# Altium schematic sheet CC1101-Sheet.SchDoc
size A4; SheetNumber: 3; SheetTotal: 3
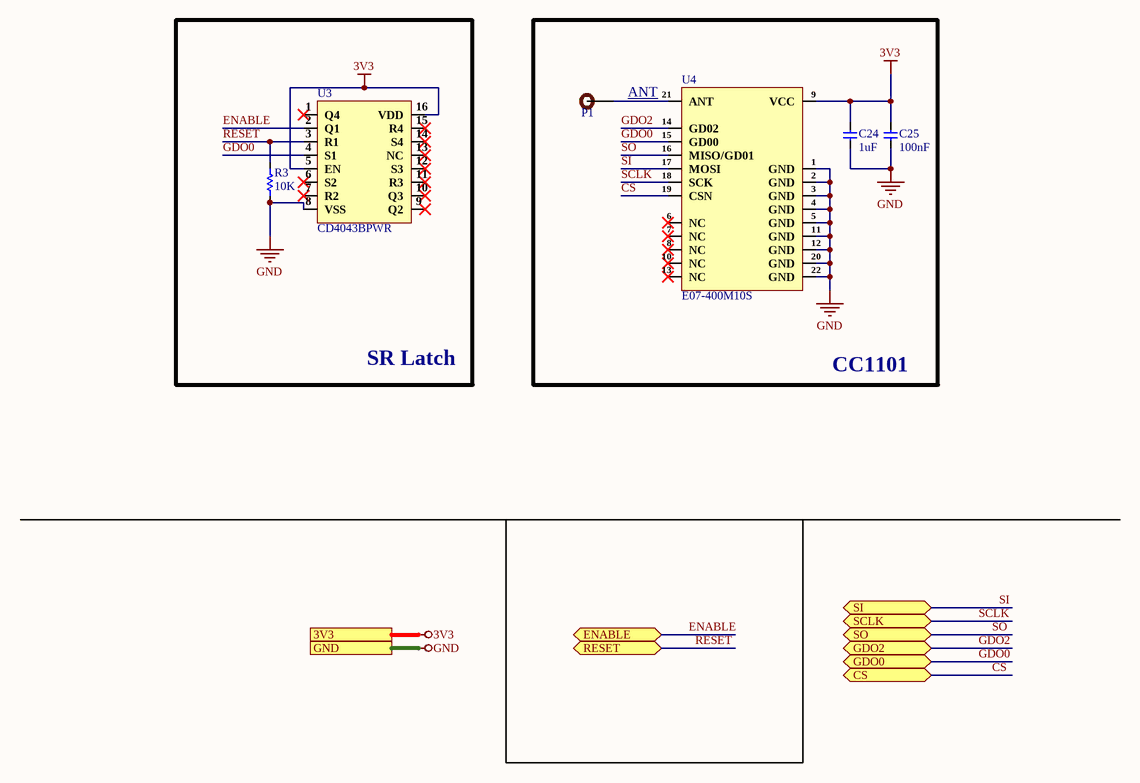
[diagram p0: CC1101-Sheet.SchDoc]

## Parts
C24  1uF  [Cap-0201]
C25  100nF  [Cap-0201]
P1  TEST POINT  [Test-point]  (value not drawn)
R3  10K  [Res-0201]
U3  CD4043BPWR  [TSSOP_16]
U4  E07-400M10S  [E07-400M10S]

## Blocks framed on the sheet
SR Latch: R3 U3
CC1101: C24 C25 P1 U4

## Ports
3V3 (see Top-Sheet[2C], Controller-Sheet[1D]), CS (bidir, see Top-Sheet[2B], Controller-Sheet[3D]), ENABLE (bidir, see Top-Sheet[2B], Controller-Sheet[2D]), GDO0 (bidir, see Top-Sheet[2B], Controller-Sheet[3D]), GDO2 (bidir, see Top-Sheet[2B], Controller-Sheet[3D]), GND (see Top-Sheet[2C], Controller-Sheet[1D]), RESET (bidir, see Top-Sheet[2B], Controller-Sheet[2D]), SCLK (bidir, see Top-Sheet[2B], Controller-Sheet[3D]), SI (bidir, see Top-Sheet[2B], Controller-Sheet[3D]), SO (bidir, see Top-Sheet[2B], Controller-Sheet[3D])

## Nets
3V3: C24.2 C25.2 U3.5(EN) U3.16(VDD) U4.9(VCC) ; port 3V3
GND: C24.1 C25.1 R3.1 U3.8(VSS) U4.1(GND) U4.2(GND) U4.3(GND) U4.4(GND) U4.5(GND) U4.11(GND) U4.12(GND) U4.20(GND) U4.22(GND) ; port GND
CS: U4.19(CSN) ; port CS
ENABLE: U3.2(Q1) ; port ENABLE
GDO0: U3.4(S1) U4.15(GD00) ; port GDO0
GDO2: U4.14(GD02) ; port GDO2
RESET: R3.2 U3.3(R1) ; port RESET
SCLK: U4.18(SCK) ; port SCLK
SI: U4.17(MOSI) ; port SI
SO: U4.16(MISO/GD01) ; port SO
NetP1_1: P1.1 U4.21(ANT)

Not connected (* = marked no-connect by the designer): U3 1(Q4)* 6(S2)* 7(R2)* 9(Q2)* 10(Q3)* 11(R3)* 12(S3)* 13(NC)* 14(S4)* 15(R4)*; U4 6(NC)* 7(NC)* 8(NC)* 10(NC)* 13(NC)*

## Notes on the sheet
- ANT <Add 10pF cap here>
- File:
- Title:
- Date:
- Page
- Num:
- Total:
- Drawn By: Huzaifa Ali

## Library data of the parts
C24 = CC0201KRX5R5BB105: CAP CER 1UF 6.3V X5R 0201; Manufacturer: Yageo; Tolerance: 10%; Item Type: Capacitor; Supplier 1: Arrow Electronics; Manufacturer Part Number: CC0201KRX5R5BB105; RoHS: Yes; Category: Ceramic Capacitors; Stock 1: 600000; Pricing 1: 15000=0.00740 (USD); Mount: Surface Mount; Case/Package: 0201; Case Code (Imperial): 0201; Case Code (Metric): 0603; Min Operating Temperature: -55°C; Max Operating Temperature: 85°C; Packaging: Cut Tape; Capacitance: 1uF; Voltage Rating: 6.3V; RoHS Compliant: Yes; ComponentLink1URL: http://www.yageo.com/documents/recent/UPY-GPHC_X5R_4V-to-50V_25.pdf?src-supplier=Digi-Key; ComponentLink1Description: http://www.yageo.com/documents/recent/UPY-GPHC_X5R_4V-to-50V_25.pdf?src-supplier=Digi-Key; ComponentLink2URL: https://www.yageo.com/upload/media/product/productsearch/datasheet/mlcc/UPY-GPHC_X5R_4V-to-50V_26.pdf?src-supplier=Digi-Key; ComponentLink2Description: https://www.yageo.com/upload/media/product/productsearch/datasheet/mlcc/UPY-GPHC_X5R_4V-to-50V_26.pdf?src-supplier=Digi-Key; Supplier Part Number 1: CC0201KRX5R5BB105; LCSC Part Number: C541330
C25 = CC0201KRX5R5BB104: CAP CER 0.1UF 6.3V X5R 0201; Manufacturer: Yageo; Tolerance: 10%; Supplier 1: Avnet; Manufacturer Part Number: CC0201KRX5R5BB104; RoHS: Yes; Category: Ceramic Capacitors; Stock 1: 1290000; Pricing 1: 15000=0.00238 (USD); Mount: Surface Mount; Case/Package: 0201; Number of Pins: 2; Case Code (Imperial): 0201; Case Code (Metric): 0603; Min Operating Temperature: -55°C; Max Operating Temperature: 85°C; Capacitance: 100nF; Dielectric: X5R; Voltage Rating: 6.3V; Packaging: Tape and Reel; Package Quantity: 1; Voltage Rating (DC): 6.3V; Termination: SMD/SMT; Resistor Type: Ceramic; Series: CC; Length: 0.6mm; Width: 0.012inch; Height: 0.3mm; Thickness: 0.013inch; Depth: 0.3mm; Reach SVHC Compliant: Yes; Lead Free: Lead Free; Halogen Free: Halogen Free; RoHS Compliant: Yes; ComponentLink1URL: https://datasheet.ciiva.com/7656/1525783-7656597.pdf?src-supplier=Element14; ComponentLink1Description: https://datasheet.ciiva.com/7656/1525783-7656597.pdf?src-supplier=Element14; ComponentLink2URL: https://datasheet.ciiva.com/28450/1359354-28450200.pdf?src-supplier=Element14; ComponentLink2Description: https://datasheet.ciiva.com/28450/1359354-28450200.pdf?src-supplier=Element14; ComponentLink3URL: https://datasheet.ciiva.com/176/mlccorderingcode-176766.pdf?src-supplier=Digi-Key; ComponentLink3Description: https://datasheet.ciiva.com/176/mlccorderingcode-176766.pdf?src-supplier=Digi-Key; ComponentLink4URL: https://datasheet.ciiva.com/176/mlccorderingcode-176765.pdf?src-supplier=Digi-Key; ComponentLink4Description: https://datasheet.ciiva.com/176/mlccorderingcode-176765.pdf?src-supplier=Digi-Key; ComponentLink5URL: https://datasheet.ciiva.com/176/mlccorderingcode-176767.pdf?src-supplier=Digi-Key; ComponentLink5Description: https://datasheet.ciiva.com/176/mlccorderingcode-176767.pdf?src-supplier=Digi-Key; Supplier Part Number 1: CC0201KRX5R5BB104
P1 = TEST POINT: Test Point ON; Item Type: TEST POINT
R3 = RC0201JR-0710KL: RES SMD 10K OHM 5% 1/20W 0201; Manufacturer: Yageo; Voltage Rating (DC): 25V; Power Rating: 50mW; Resistance: 10kR; Temperature Coefficient: 200ppm/°C; Case Code (Imperial): 0201; Case Code (Metric): 0603; Case/Package: 0201; Category: Chip SMD Resistors; Contact Plating: Tin,Matte; Depth: 0.3mm; Lead Free: Lead Free; Length: 0.6mm; Manufacturer Part Number: RC0201JR-0710KL; Max Operating Temperature: 125°C; Military Standard: Not; Min Operating Temperature: -55°C; Packaging: Tape and Reel; Radiation Hardening: No; REACH SVHC: Unknown; Resistor Type: Thick Film; Termination: SMD/SMT; Tolerance: 5%; Voltage Rating: 25V; ComponentLink1Description: New link; ComponentLink1URL: *; Supplier 1: Digi-Key; RoHS: Yes; Stock 1: 1488597; Pricing 1: 1=0.10000, 10=0.02600, 100=0.01050, 1000=0.00472, 2500=0.00410, 5000=0.00338 (USD); ComponentLink2URL: https://datasheet.ciiva.com/8891/pyu-rc0201-51-rohs-l-8-8891388.pdf?src-supplier=Avnet; ComponentLink2Description: https://datasheet.ciiva.com/8891/pyu-rc0201-51-rohs-l-8-8891388.pdf?src-supplier=Avnet; ComponentLink3URL: https://datasheet.ciiva.com/7672/1563626-7672253.pdf?src-supplier=Element14; ComponentLink3Description: https://datasheet.ciiva.com/7672/1563626-7672253.pdf?src-supplier=Element14; ComponentLink4URL: https://datasheet.ciiva.com/28405/pyu-rc0201-51-rohs-l-8-28405613.pdf?src-supplier=Avnet+Europe; ComponentLink4Description: https://datasheet.ciiva.com/28405/pyu-rc0201-51-rohs-l-8-28405613.pdf?src-supplier=Avnet+Europe; ComponentLink5URL: https://datasheet.ciiva.com/7672/1563626-7672254.pdf?src-supplier=Element14; ComponentLink5Description: https://datasheet.ciiva.com/7672/1563626-7672254.pdf?src-supplier=Element14; ComponentLink6URL: https://datasheet.ciiva.com/7660/1421516-7660810.pdf?src-supplier=Element14; ComponentLink6Description: https://datasheet.ciiva.com/7660/1421516-7660810.pdf?src-supplier=Element14; ComponentLink7URL: https://datasheet.ciiva.com/16856/pyu-rc0201-51-rohs-l-8-16856011.pdf?src-supplier=Avnet+Europe; ComponentLink7Description: https://datasheet.ciiva.com/16856/pyu-rc0201-51-rohs-l-8-16856011.pdf?src-supplier=Avnet+Europe; ComponentLink8URL: https://datasheet.ciiva.com/46391/1421516-46391291.pdf?src-supplier=Element14; ComponentLink8Description: https://datasheet.ciiva.com/46391/1421516-46391291.pdf?src-supplier=Element14; Supplier Part Number 1: 311-10KNCT-ND; LCSC Part Number: C138117
U3 = CD4043BPWR: 16-Bit Transparent D-Type Latch With 3-State Outputs 48-TVSOP -40 to 125; Manufacturer: Texas Instruments; Manufacturer Part Number: SN74LVC16373ADGVR; Item Type: IC; Supplier: Digi-Key; Supplier Part Number: 296-13242-1-ND; RoHS: Yes; Category: Latches and Flip Flops; Stock: 4536; Pricing: 1=1.51, 10=1.353, 25=1.284, 100=1.0546, 250=0.98588, 500=0.87122, 1000=0.68781 (USD); ComponentLink1URL: https://datasheet.ciiva.com/14288/sn74lvc16373a-14288272.pdf?src-supplier=Avnet; ComponentLink1Description: https://datasheet.ciiva.com/14288/sn74lvc16373a-14288272.pdf?src-supplier=Avnet; ComponentLink2URL: https://datasheet.ciiva.com/22746/1840227-22746081.pdf?src-supplier=Element14; ComponentLink2Description: https://datasheet.ciiva.com/22746/1840227-22746081.pdf?src-supplier=Element14; ComponentLink3URL: https://datasheet.ciiva.com/15088/getdatasheetpartid-527425-15088839.pdf?src-supplier=Verical; ComponentLink3Description: https://datasheet.ciiva.com/15088/getdatasheetpartid-527425-15088839.pdf?src-supplier=Verical; ComponentLink4URL: https://datasheet.ciiva.com/1882/sn74lvc16373a-1882418.pdf?src-supplier=Digi-Key; ComponentLink4Description: https://datasheet.ciiva.com/1882/sn74lvc16373a-1882418.pdf?src-supplier=Digi-Key; ComponentLink5URL: https://datasheet.ciiva.com/1882/sn74lvc16373a-1882419.pdf?src-supplier=Digi-Key; ComponentLink5Description: https://datasheet.ciiva.com/1882/sn74lvc16373a-1882419.pdf?src-supplier=Digi-Key; ComponentLink6URL: https://datasheet.ciiva.com/1882/sn74lvc16373a-1882420.pdf?src-supplier=Digi-Key; ComponentLink6Description: https://datasheet.ciiva.com/1882/sn74lvc16373a-1882420.pdf?src-supplier=Digi-Key; ComponentLink7URL: https://datasheet.ciiva.com/1508/1840227-1508576.pdf?src-supplier=Element14; ComponentLink7Description: https://datasheet.ciiva.com/1508/1840227-1508576.pdf?src-supplier=Element14; ComponentLink8URL: https://datasheet.ciiva.com/48704/001075154-da-01-en-ic-trans-sn74lvc16373adgvr-tvsop-48-tid-48704295.pdf?src-supplier=Conrad; ComponentLink8Description: https://datasheet.ciiva.com/48704/001075154-da-01-en-ic-trans-sn74lvc16373adgvr-tvsop-48-tid-48704295.pdf?src-supplier=Conrad; LCSC Part Number: C2652970; ComponentLink9Description: LCSC; ComponentLink9URL: https://www.lcsc.com/product-detail/Latches_Texas-Instruments-CD4043BPWR_C2652970.html
U4 = E07-400M10S: RF Modules ROHS; Manufacturer: Chengdu Ebyte Elec Tech; Item Type: Module; Manufacturer Part Number: E07-400M10S; Package: Custom; LCSC Part Number: C2965513; ComponentLink1Description: LCSC; ComponentLink1URL: https://www.lcsc.com/product-detail/RF-Modules_Chengdu-Ebyte-Elec-Tech-E07-400M10S_C2965513.html